# Altium schematic sheet MAIN.SchDoc
size A3; SheetNumber: 1; SheetTotal: 12
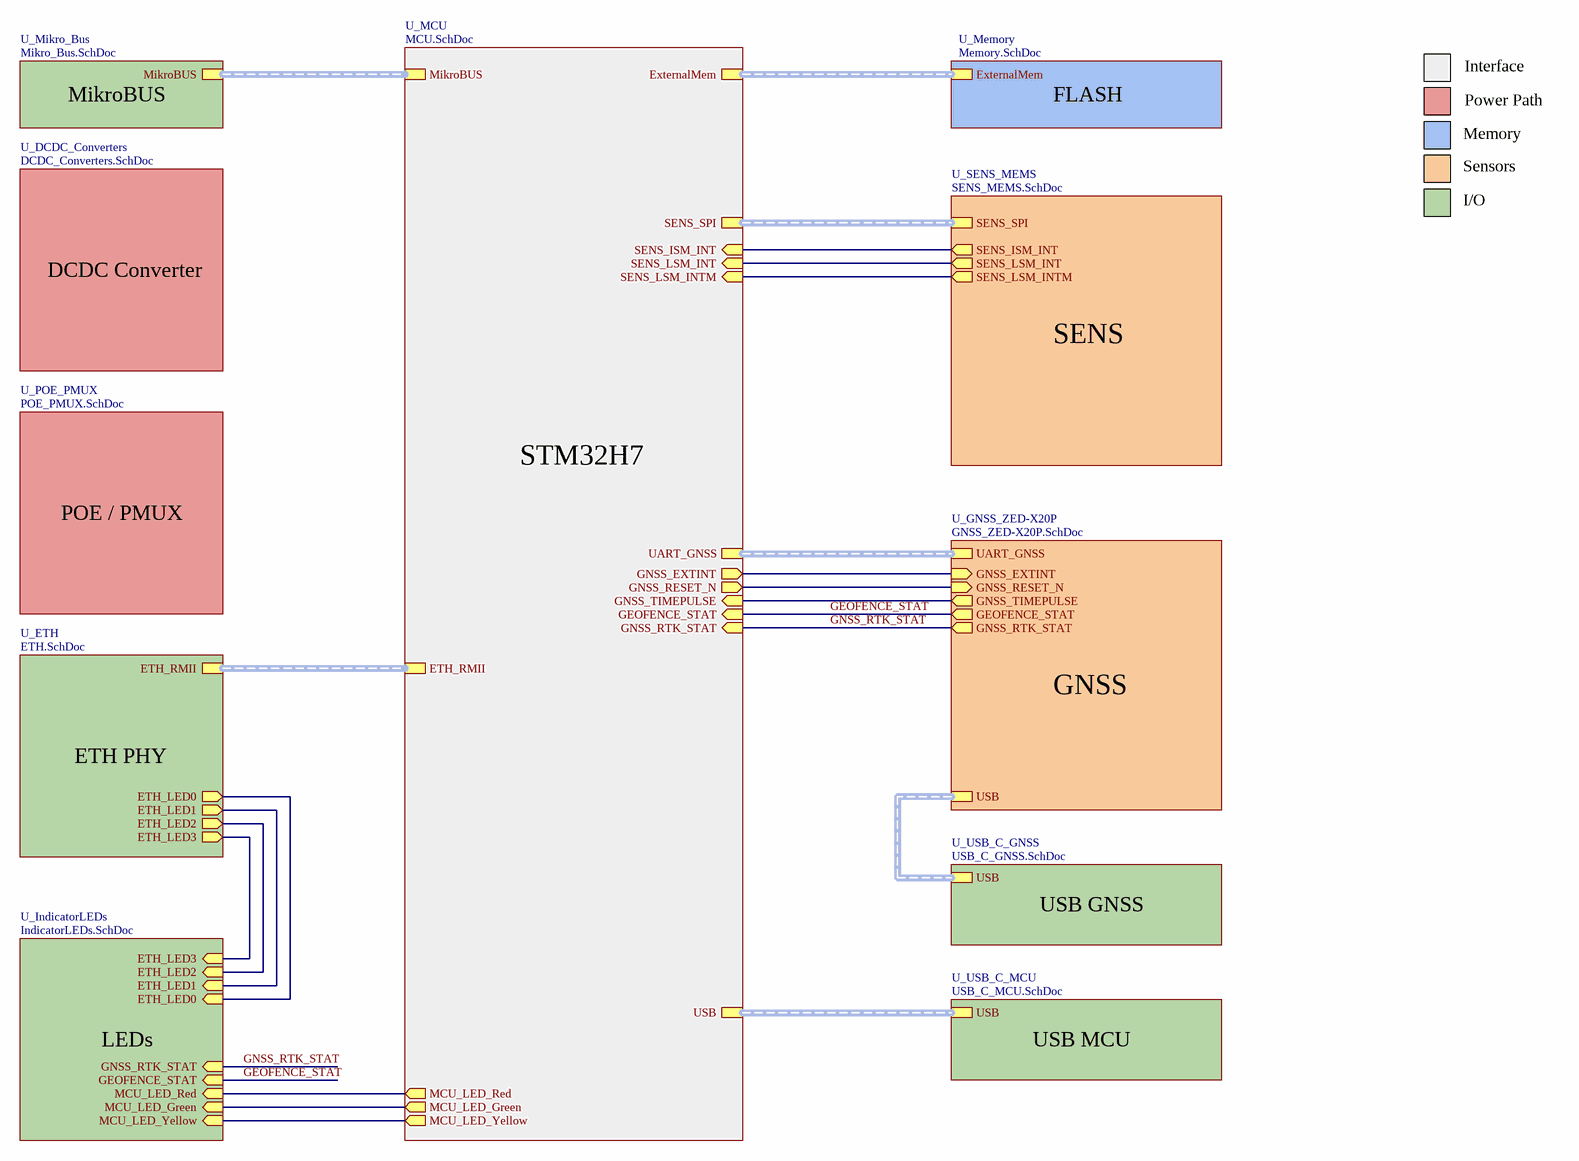
[diagram p0: MAIN.SchDoc]

## Sub-sheets
U_DCDC_Converters = DCDC_Converters.SchDoc: no entries
U_ETH = ETH.SchDoc: ETH_RMII (harness ETH_RMII), ETH_LED0 (out), ETH_LED1 (out), ETH_LED2 (out), ETH_LED3 (out)
U_GNSS_ZED-X20P = GNSS_ZED-X20P.SchDoc: GNSS_TIMEPULSE (out), GNSS_EXTINT (in), USB (harness USB_GNSS), GEOFENCE_STAT (out), UART_GNSS (harness UART3), GNSS_RTK_STAT (out), GNSS_RESET_N (in)
U_IndicatorLEDs = IndicatorLEDs.SchDoc: ETH_LED2 (in), ETH_LED3 (in), ETH_LED0 (in), ETH_LED1 (in), MCU_LED_Yellow (in), MCU_LED_Green (in), MCU_LED_Red (in), GNSS_RTK_STAT (in), GEOFENCE_STAT (in)
U_MCU = MCU.SchDoc: ETH_RMII (harness ETH_RMII), USB (harness USB_MCU), ExternalMem (harness ExternalMem), MCU_LED_Green (out), MCU_LED_Red (out), MCU_LED_Yellow (out), SENS_SPI (harness SENS_SPI), SENS_LSM_INTM (in), SENS_LSM_INT (in), SENS_ISM_INT (in), UART_GNSS (harness UART3), GNSS_TIMEPULSE (in), GNSS_EXTINT (out), GEOFENCE_STAT (in), MikroBUS (harness MikroBUS), GNSS_RTK_STAT (in), GNSS_RESET_N (out)
U_Memory = Memory.SchDoc: ExternalMem (harness ExternalMem)
U_Mikro_Bus = Mikro_Bus.SchDoc: MikroBUS (harness MikroBUS)
U_POE_PMUX = POE_PMUX.SchDoc: no entries
U_SENS_MEMS = SENS_MEMS.SchDoc: SENS_LSM_INTM (out), SENS_LSM_INT (out), SENS_ISM_INT (out), SENS_SPI (harness SENS_SPI)
U_USB_C_GNSS = USB_C_GNSS.SchDoc: USB (harness USB_GNSS)
U_USB_C_MCU = USB_C_MCU.SchDoc: USB (harness USB_MCU)

## Nets
GEOFENCE_STAT: sheet U_MCU/GEOFENCE_STAT, sheet U_GNSS_ZED-X20P/GEOFENCE_STAT, sheet U_IndicatorLEDs/GEOFENCE_STAT
GNSS_RTK_STAT: sheet U_MCU/GNSS_RTK_STAT, sheet U_GNSS_ZED-X20P/GNSS_RTK_STAT, sheet U_IndicatorLEDs/GNSS_RTK_STAT
(unnamed): sheet U_MCU/MCU_LED_Green, sheet U_IndicatorLEDs/MCU_LED_Green
(unnamed): sheet U_MCU/MCU_LED_Red, sheet U_IndicatorLEDs/MCU_LED_Red
(unnamed): sheet U_MCU/MCU_LED_Yellow, sheet U_IndicatorLEDs/MCU_LED_Yellow
(unnamed): sheet U_MCU/SENS_LSM_INTM, sheet U_SENS_MEMS/SENS_LSM_INTM
(unnamed): sheet U_MCU/SENS_LSM_INT, sheet U_SENS_MEMS/SENS_LSM_INT
(unnamed): sheet U_MCU/SENS_ISM_INT, sheet U_SENS_MEMS/SENS_ISM_INT
(unnamed): sheet U_MCU/GNSS_TIMEPULSE, sheet U_GNSS_ZED-X20P/GNSS_TIMEPULSE
(unnamed): sheet U_MCU/GNSS_EXTINT, sheet U_GNSS_ZED-X20P/GNSS_EXTINT
(unnamed): sheet U_MCU/GNSS_RESET_N, sheet U_GNSS_ZED-X20P/GNSS_RESET_N
(unnamed): sheet U_IndicatorLEDs/ETH_LED2, sheet U_ETH/ETH_LED2
(unnamed): sheet U_IndicatorLEDs/ETH_LED3, sheet U_ETH/ETH_LED3
(unnamed): sheet U_IndicatorLEDs/ETH_LED0, sheet U_ETH/ETH_LED0
(unnamed): sheet U_IndicatorLEDs/ETH_LED1, sheet U_ETH/ETH_LED1

## Buses and harness runs
harness sheet U_ETH/ETH_RMII = sheet U_MCU/ETH_RMII
harness sheet U_GNSS_ZED-X20P/UART_GNSS = sheet U_MCU/UART_GNSS
harness sheet U_GNSS_ZED-X20P/USB = sheet U_USB_C_GNSS/USB
harness sheet U_MCU/ExternalMem = sheet U_Memory/ExternalMem
harness sheet U_MCU/MikroBUS = sheet U_Mikro_Bus/MikroBUS
harness sheet U_MCU/SENS_SPI = sheet U_SENS_MEMS/SENS_SPI
harness sheet U_MCU/USB = sheet U_USB_C_MCU/USB

## Notes on the sheet
- Interface
- MikroBUS
- FLASH
- Memory
- Power Path
- Sensors
- I/O
- DCDC Converter
- SENS
- STM32H7
- POE / PMUX
- ETH PHY
- GNSS
- USB GNSS
- LEDs
- USB MCU
- Project:
- Drawing number:
- Date:
- 1
- Rev:
- Format:
- A3
- Laboratory:
- Drawn by:
- Sheet:
- Page:
- of
- File: